# Altium project Francisco Gimenez.PrjPCB (part 1 of 3)
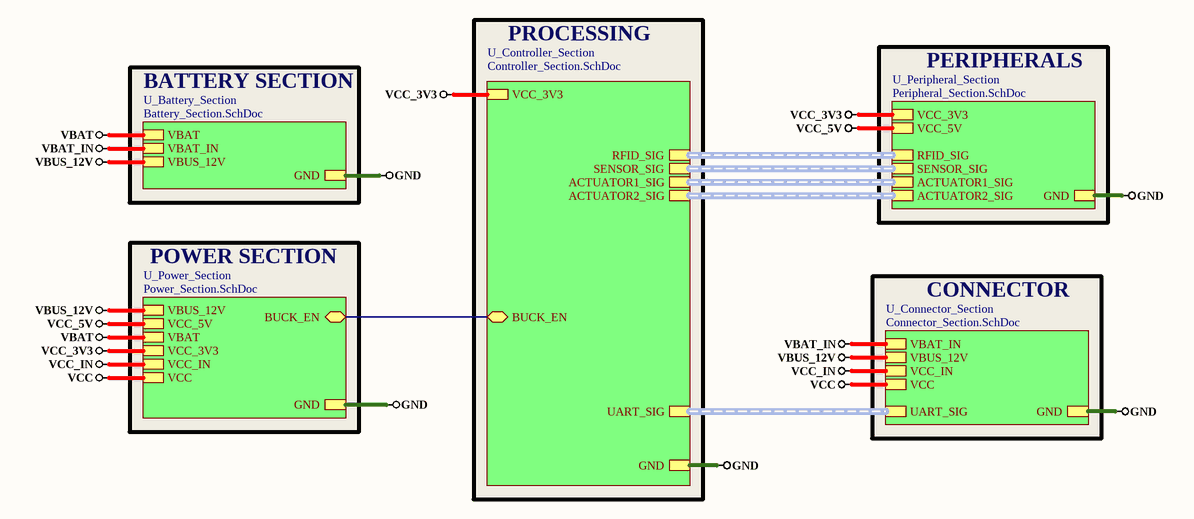
[diagram p0: Top_Sheet.SchDoc]
13 sheets, 112 parts. Net scope: hierarchical (ports join the sheet entries above them; power ports are global).
Board file: HCD_PCB.PcbDoc
Sheets:
  Top_Sheet.SchDoc
    U_Controller_Section = Controller_Section.SchDoc
    U_Connector_Section = Connector_Section.SchDoc
    U_Battery_Section = Battery_Section.SchDoc
      U_Battery_Management_Section = Battery_Management_Section.SchDoc
      U_LiFePo_Charging_Section = LiFePo_Charging_Section.SchDoc
    U_Peripheral_Section = Peripheral_Section.SchDoc
      U_Sensor_Section = Sensor_Section.SchDoc
      U_Actuator_Section = Actuator_Section.SchDoc
      U_Actuator_Section2 = Actuator_Section2.SchDoc
    U_Power_Section = Power_Section.SchDoc
      U_MCU_Power_Section = MCU_Power_Section.SchDoc
      U_Buck_Regulator_Section = Buck_Regulator_Section.SchDoc

## Sheet Top_Sheet.SchDoc
size A; DocumentNumber: 1; SheetNumber: 1; SheetTotal: 13

### Sub-sheets
U_Battery_Section = Battery_Section.SchDoc: VBAT, VBAT_IN, GND, VBUS_12V
U_Connector_Section = Connector_Section.SchDoc: GND, UART_SIG (harness UART_SIG), VBAT_IN, VBUS_12V, VCC_IN, VCC
U_Controller_Section = Controller_Section.SchDoc: ACTUATOR1_SIG (harness ACTUATOR1_SIG), ACTUATOR2_SIG (harness ACTUATOR2_SIG), GND, VCC_3V3, UART_SIG (harness UART_SIG), SENSOR_SIG (harness SENSOR_SIG), RFID_SIG (harness RFID_SIG), BUCK_EN (bidir)
U_Peripheral_Section = Peripheral_Section.SchDoc: GND, RFID_SIG (harness RFID_SIG), SENSOR_SIG (harness SENSOR_SIG), ACTUATOR2_SIG (harness ACTUATOR2_SIG), VCC_3V3, VCC_5V, ACTUATOR1_SIG (harness ACTUATOR1_SIG)
U_Power_Section = Power_Section.SchDoc: GND, VBUS_12V, VCC_5V, VBAT, VCC_3V3, VCC_IN, VCC, BUCK_EN (bidir)

### Nets
GND: sheet U_Controller_Section/GND, sheet U_Connector_Section/GND, sheet U_Battery_Section/GND, sheet U_Peripheral_Section/GND, sheet U_Power_Section/GND
VBAT: sheet U_Battery_Section/VBAT, sheet U_Power_Section/VBAT
VBAT_IN: sheet U_Connector_Section/VBAT_IN, sheet U_Battery_Section/VBAT_IN
VBUS_12V: sheet U_Connector_Section/VBUS_12V, sheet U_Battery_Section/VBUS_12V, sheet U_Power_Section/VBUS_12V
VCC: sheet U_Connector_Section/VCC, sheet U_Power_Section/VCC
VCC_3V3: sheet U_Controller_Section/VCC_3V3, sheet U_Peripheral_Section/VCC_3V3, sheet U_Power_Section/VCC_3V3
VCC_5V: sheet U_Peripheral_Section/VCC_5V, sheet U_Power_Section/VCC_5V
VCC_IN: sheet U_Connector_Section/VCC_IN, sheet U_Power_Section/VCC_IN
BUCK_EN: sheet U_Controller_Section/BUCK_EN, sheet U_Power_Section/BUCK_EN

### Buses and harness runs
harness sheet U_Connector_Section/UART_SIG = sheet U_Controller_Section/UART_SIG
harness sheet U_Controller_Section/ACTUATOR1_SIG = sheet U_Peripheral_Section/ACTUATOR1_SIG
harness sheet U_Controller_Section/ACTUATOR2_SIG = sheet U_Peripheral_Section/ACTUATOR2_SIG
harness sheet U_Controller_Section/RFID_SIG = sheet U_Peripheral_Section/RFID_SIG
harness sheet U_Controller_Section/SENSOR_SIG = sheet U_Peripheral_Section/SENSOR_SIG

### Notes on the sheet
- BATTERY SECTION
- PROCESSING
- PERIPHERALS
- POWER SECTION
- CONNECTOR

## Sheet Controller_Section.SchDoc
size A; DocumentNumber: 12; SheetNumber: 12; SheetTotal: 13
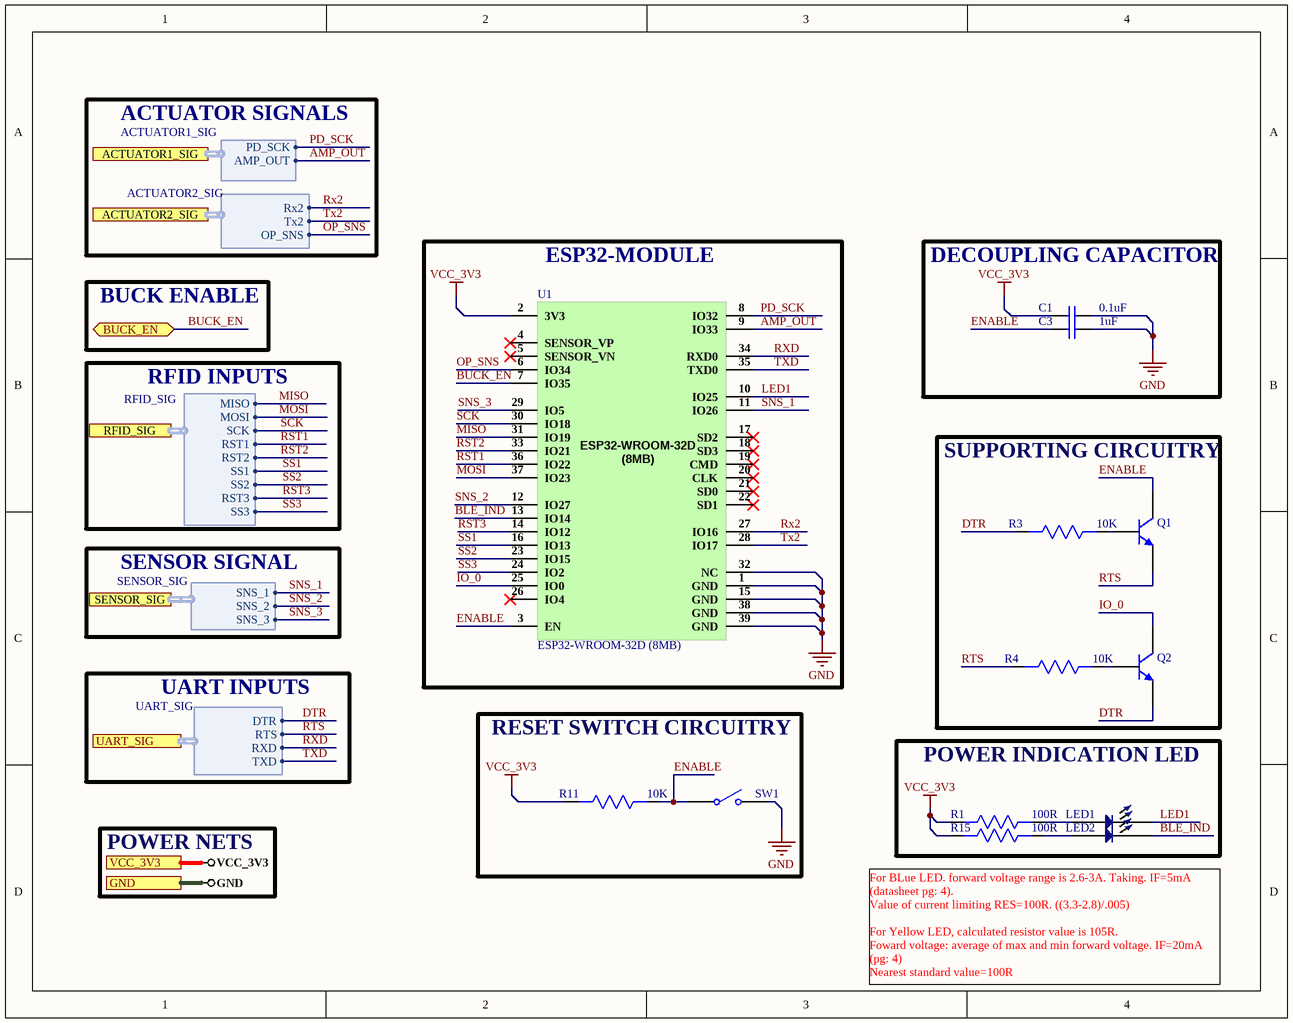
[diagram p1: Controller_Section.SchDoc]

### Parts
C1  0.1uF  [CAP-0603]
C3  1uF  [CAP-0603]
LED1  LTST-C170KSKT  [LTST-C170KSKT]  (value not drawn)
LED2  17-21/BHC-XL2M2TY/3T  [17-21/BHC-XL2M2TY/3T]  (value not drawn)
Q1  MMBT2222A-7-F  [sot-23]  (value not drawn)
Q2  MMBT2222A-7-F  [sot-23]  (value not drawn)
R1  100R  [RES-0603]
R3  10K  [RES-0603]
R4  10K  [RES-0603]
R11  10K  [RES-0603]
R15  100R  [RES-0603]
SW1  B3U-1000P  [B3U-1000P]  (value not drawn)
U1  ESP32-WROOM-32D (8MB)  [ESP32-WROOM-32D (8MB)]

### Blocks framed on the sheet
ESP32-MODULE: U1
DECOUPLING CAPACITOR: C1 C3
SUPPORTING CIRCUITRY: Q1 Q2 R3 R4
RESET SWITCH CIRCUITRY: R11 SW1
POWER INDICATION LED: LED1 LED2 R1 R15

### Ports
ACTUATOR1_SIG (harness ACTUATOR1_SIG), ACTUATOR2_SIG (harness ACTUATOR2_SIG), BUCK_EN (bidir), GND, RFID_SIG (harness RFID_SIG), SENSOR_SIG (harness SENSOR_SIG), UART_SIG (harness UART_SIG), VCC_3V3

### Harnesses
UART_SIG: RXD, TXD, DTR, RTS
SENSOR_SIG: SNS_1, SNS_2, SNS_3
ACTUATOR1_SIG: PD_SCK, AMP_OUT
ACTUATOR2_SIG: Rx2, Tx2, OP_SNS
RFID_SIG: MOSI, SCK, RST1, MISO, RST2, SS1, SS2, SS3, RST3

### Nets
GND: C1.2 C3.2 SW1.2 U1.1(GND) U1.15(GND) U1.32(NC) U1.38(GND) U1.39(GND) ; port GND
VCC_3V3: C1.1 R1.2 R11.2 R15.2 U1.2(3V3) ; port VCC_3V3
AMP_OUT: U1.9(IO33) ; port ACTUATOR1_SIG.AMP_OUT  [project net ACTUATOR1_SIG.AMP_OUT]
BLE_IND: LED2.2 U1.13(IO14)
BUCK_EN: U1.7(IO35) ; port BUCK_EN
DTR: Q2.2(E) R3.2 ; port UART_SIG.DTR
ENABLE: C3.1 Q1.3(C) R11.1 SW1.1 U1.3(EN)
IO_0: Q2.3(C) U1.25(IO0)
LED1: LED1.2 U1.10(IO25)
MISO: U1.31(IO19) ; port RFID_SIG.MISO
MOSI: U1.37(IO23) ; port RFID_SIG.MOSI
OP_SNS: U1.6(IO34) ; port ACTUATOR2_SIG.OP_SNS  [project net ACTUATOR2_SIG.OP_SNS]
PD_SCK: U1.8(IO32) ; port ACTUATOR1_SIG.PD_SCK  [project net ACTUATOR1_SIG.PD_SCK]
RST1: U1.36(IO22) ; port RFID_SIG.RST1  [project net RFID_SIG.RST1]
RST2: U1.33(IO21) ; port RFID_SIG.RST2  [project net RFID_SIG.RST2]
RTS: Q1.2(E) R4.2 ; port UART_SIG.RTS
Rx2: U1.27(IO16) ; port ACTUATOR2_SIG.Rx2  [project net ACTUATOR2_SIG.Rx2]
RXD: U1.34(RXD0) ; port UART_SIG.RXD
SCK: U1.30(IO18) ; port RFID_SIG.SCK  [project net RFID_SIG.SCK]
SNS_1: U1.11(IO26) ; port SENSOR_SIG.SNS_1  [project net SENSOR_SIG.SNS_1]
SNS_2: U1.12(IO27) ; port SENSOR_SIG.SNS_2  [project net SENSOR_SIG.SNS_2]
SNS_3: U1.29(IO5) ; port SENSOR_SIG.SNS_3  [project net SENSOR_SIG.SNS_3]
SS1: U1.16(IO13) ; port RFID_SIG.SS1  [project net RFID_SIG.SS1]
SS2: U1.23(IO15) ; port RFID_SIG.SS2  [project net RFID_SIG.SS2]
Tx2: U1.28(IO17) ; port ACTUATOR2_SIG.Tx2  [project net ACTUATOR2_SIG.Tx2]
TXD: U1.35(TXD0) ; port UART_SIG.TXD
NetLED1_1: LED1.1 R1.1
NetLED2_1: LED2.1 R15.1
NetQ1_1: Q1.1(B) R3.1
NetQ2_1: Q2.1(B) R4.1

Not connected (* = marked no-connect by the designer): U1 4(SENSOR_VP)* 5(SENSOR_VN)* 14(IO12) 17(SD2)* 18(SD3)* 19(CMD)* 20(CLK)* 21(SD0)* 22(SD1)* 24(IO2) 26(IO4)*

### Notes on the sheet
- ACTUATOR SIGNALS
- BUCK ENABLE
- RFID INPUTS
- SENSOR SIGNAL
- UART INPUTS
- POWER NETS
- For BLue LED. forward voltage range is 2.6-3A. Taking. IF=5mA (datasheet pg: 4).
  Value of current limiting RES=100R. ((3.3-2.8)/.005)
  For Yellow LED, calculated resistor value is 105R.
  Foward voltage: average of max and min forward voltage. IF=20mA (pg: 4)
  Nearest standard value=100R
- (in symbol ESP32-WROOM-32D (8MB)) ESP32-WROOM-32D (8MB) /

### Library data of the parts
C1 = CL10B104KB8NNNL: CAP CER 0.1UF 50V X7R 0603; Manufacturer: Samsung; Capacitance: 100nF; Tolerance: 10%; Supplier 1: Digi-Key; Manufacturer Part Number: CL10B104KB8NNNL; Stock 1: 3731229; Pricing 1: 1=0.1, 10=0.03, 50=0.0164, 100=0.0134, 500=0.00958, 1000=0.00753, 2500=0.00684, 5000=0.0063 (USD); Mount: Surface Mount; Case/Package: 0603; Min Operating Temperature: -55°C; Max Operating Temperature: 125°C; Dielectric: X7R; Packaging: Tape and Reel; Package Quantity: 15000; Voltage Rating: 50V; Voltage Rating (DC): 50V; Series: CL; Construction: Flat; Length: 1.6mm; Width: 0.031inch; Height: 0.8mm; Thickness: 0.035inch; Depth: 0.8mm; Radiation Hardening: No; RoHS Compliant: Yes; ComponentLink1URL: https://www.verical.com/server-webapp/html/getDatasheet?partID=357523&src-supplier=Verical; ComponentLink1Description: https://www.verical.com/server-webapp/html/getDatasheet?partID=357523&src-supplier=Verical; ComponentLink2URL: https://media.digikey.com/pdf/Data%20Sheets/Samsung%20PDFs/CL_Series_MLCC_ds.pdf?src-supplier=Digi-Key; ComponentLink2Description: https://media.digikey.com/pdf/Data%20Sheets/Samsung%20PDFs/CL_Series_MLCC_ds.pdf?src-supplier=Digi-Key; Supplier Part Number 1: 1276-CL10B104KB8NNNLCT-ND
C3 = CL10A105KA8NNNC: CAP CER 1UF 25V X5R 0603; Manufacturer: Sams; Tolerance: 10%; Supplier 1: Digi-Key; Manufacturer Part Number: CL10A105KA8NNNC; Stock 1: 2768758; Pricing 1: 1=0.1, 10=0.036, 50=0.0198, 100=0.0161, 500=0.01152, 1000=0.00904 (USD); Mount: Surface Mount; Case/Package: 0603; Min Operating Temperature: -55°C; Max Operating Temperature: 85°C; Capacitance: 1uF; Dielectric: X5R; Voltage Rating (DC): 25V; Voltage: 25V; Length: 1.6mm; Height: 0.8mm; Depth: 0.8mm; Lead Free: Lead Free; Supplier Part Number 1: 1276-1102-1-ND
LED1 = LTST-C170KSKT: Yellow 2 x 1.25 x 1.1 mm 130° Water Clear 112 mcd 1.8 V LED Surface Mount; Manufacturer: Vishay Lite-On; Lens Color: Colorless; Forward Voltage: 2.4V; Forward Current: 30mA; Luminous Intensity: 112mcd; Lens Style: Diffused,Colorless,Rectangular,Clear; Power Rating: 75mW; Dominant Wavelength: 587nm; Test Current: 20mA; Number of Elements: 1; Wavelength: 588nm; Reverse Voltage: 5V; Supplier 1: Digi-Key; Manufacturer Part Number: LTST-C170KSKT; RoHS: Yes; Category: LEDs; Stock 1: 4224; Pricing 1: 1=0.31000, 10=0.16900, 100=0.07860, 500=0.07260, 1000=0.05687 (USD); Mount: Surface Mount; Case/Package: 0805; Number of Pins: 2; Color: Yellow; Case Code (Metric): 2012; Case Code (Imperial): 0805; Min Operating Temperature: -55°C; Max Operating Temperature: 85°C; Packaging: Tape and Reel; Viewing Angle: 130°; Package Quantity: 1; Illumination Color: Yellow; Lens Transparency: Clear; Power Dissipation: 75mW; Number of LEDs: 1; Series: CHIPLED 0805; Length: 2mm; Width: 1.25mm; Height: 1.1mm; Depth: 1.25mm; Radiation Hardening: No; Lead Free: Lead Free; RoHS Compliant: Yes; ComponentLink1URL: https://datasheet.ciiva.com/11774/0900766b80dc027c-11774116.pdf?src-supplier=RSComponents; ComponentLink1Description: https://datasheet.ciiva.com/11774/0900766b80dc027c-11774116.pdf?src-supplier=RSComponents; ComponentLink2URL: https://datasheet.ciiva.com/12400/lite-on-ltst-c170kskt-187240-12400806.pdf?src-supplier=Mouser; ComponentLink2Description: https://datasheet.ciiva.com/12400/lite-on-ltst-c170kskt-187240-12400806.pdf?src-supplier=Mouser; ComponentLink3URL: https://datasheet.ciiva.com/16203/ltst-c170kskt-16203829.pdf?src-supplier=Future+Electronics; ComponentLink3Description: https://datasheet.ciiva.com/16203/ltst-c170kskt-16203829.pdf?src-supplier=Future+Electronics; ComponentLink4URL: https://datasheet.ciiva.com/15118/getdatasheetpartid-214541-15118098.pdf?src-supplier=Verical; ComponentLink4Description: https://datasheet.ciiva.com/15118/getdatasheetpartid-214541-15118098.pdf?src-supplier=Verical; ComponentLink5URL: https://datasheet.ciiva.com/2110/s-110-ltst-c170kskt-2110046.pdf?src-supplier=Digi-Key; ComponentLink5Description: https://datasheet.ciiva.com/2110/s-110-ltst-c170kskt-2110046.pdf?src-supplier=Digi-Key; ComponentLink6URL: https://datasheet.ciiva.com/2110/s-110-ltst-c170kskt-2110045.pdf?src-supplier=Digi-Key; ComponentLink6Description: https://datasheet.ciiva.com/2110/s-110-ltst-c170kskt-2110045.pdf?src-supplier=Digi-Key; ComponentLink7URL: https://datasheet.ciiva.com/2110/s-110-ltst-c170kskt-2110047.pdf?src-supplier=Digi-Key; ComponentLink7Description: https://datasheet.ciiva.com/2110/s-110-ltst-c170kskt-2110047.pdf?src-supplier=Digi-Key; Supplier Part Number 1: 160-1416-1-ND
LED2 = 17-21/BHC-XL2M2TY/3T: LED BLUE 0805 SMD; Manufacturer: Everlight Elec; Emitted Color: Blue; Package: 0805
Q1 Q2 = MMBT2222A-7-F: TRANS NPN 40V 0.6A SMD SOT23-3; Manufacturer: Diodes; Max Power Dissipation: 300mW; Collector Base Voltage (VCBO): 75V; Max Collector Current: 600mA; hFE Min: 100; Frequency: 300MHz; Number of Elements: 1; Emitter Base Voltage (VEBO): 6V; Collector Emitter Saturation Voltage: 1V; Power Dissipation: 350mW; Element Configuration: Single; Current: 1A; Supplier 1: Digi-Key; Manufacturer Part Number: MMBT2222A-7-F; Stock 1: 2471182; Pricing 1: 1=0.15, 10=0.134, 100=0.0729, 500=0.04486, 1000=0.03059 (USD); Mount: Surface Mount; Case/Package: SOT-23; Number of Pins: 3; Weight: 0.000282oz; Contact Plating: Matte,Tin; Min Operating Temperature: -55°C; Max Operating Temperature: 150°C; Packaging: Tape and Reel; Collector Emitter Voltage (VCEO): 40V; Polarity: NPN; Voltage Rating (DC): 40V; Package Quantity: 3000; Continuous Collector Current: 600mA; Collector Emitter Breakdown Voltage: 40V; Transition Frequency: 300MHz; Max Breakdown Voltage: 40V; Max Frequency: 300MHz; Termination: SMD/SMT; Gain Bandwidth Product: 300MHz; Current Rating: 600mA; Voltage: 40V; Length: 3.05mm; Height: 1mm; Width: 1.4mm; Radiation Hardening: No; Lead Free: Lead Free; REACH SVHC: No SVHC; ComponentLink1URL: http://www.diodes.com/datasheets/ds30041.pdf?src-supplier=Future+Electronics; ComponentLink1Description: http://www.diodes.com/datasheets/ds30041.pdf?src-supplier=Future+Electronics; ComponentLink2URL: http://www.diodes.com/datasheets/ds30041.pdf?src-supplier=Avnet; ComponentLink2Description: http://www.diodes.com/datasheets/ds30041.pdf?src-supplier=Avnet; ComponentLink3URL: https://www.verical.com/server-webapp/html/getDatasheet?partID=82692&src-supplier=Verical; ComponentLink3Description: https://www.verical.com/server-webapp/html/getDatasheet?partID=82692&src-supplier=Verical; ComponentLink4URL: https://www.diodes.com/assets/Datasheets/ds30041.pdf?src-supplier=Digi-Key; ComponentLink4Description: https://www.diodes.com/assets/Datasheets/ds30041.pdf?src-supplier=Digi-Key; ComponentLink5URL: http://www.diodes.com/datasheets/ds30041.pdf?src-supplier=Avnet+Europe; ComponentLink5Description: http://www.diodes.com/datasheets/ds30041.pdf?src-supplier=Avnet+Europe; ComponentLink6URL: http://www.diodes.com/datasheets/ds30041.pdf?src-supplier=Element14; ComponentLink6Description: http://www.diodes.com/datasheets/ds30041.pdf?src-supplier=Element14; Supplier Part Number 1: MMBT2222A-FDIDKR-ND
R1 R15 = RCA0603100RFKEAHP: RES SMD 100 OHM 1% 1/4W 0603; Manufacturer: Vishay Dale; Max Power Dissipation: 250mW; Temperature Coefficient: 100ppm/°C; Supplier 1: Digi-Key; Manufacturer Part Number: RCA0603100RFKEAHP; Stock 1: 0; Case/Package: 0603; Case Code (Imperial): 0603; Case Code (Metric): 1608; Min Operating Temperature: -55°C; Max Operating Temperature: 155°C; Resistor Type: Thick Film; Features: Automotive AEC-Q200,Anti-Sulfur; Packaging: Tape and Reel; Resistance: 100R; Tolerance: 1%; Number of Terminations: 2; RoHS Compliant: Yes; ComponentLink1URL: http://www.vishay.com/docs/20067/rcahp.pdf?src-supplier=Digi-Key; ComponentLink1Description: http://www.vishay.com/docs/20067/rcahp.pdf?src-supplier=Digi-Key; Supplier Part Number 1: 541-3244-2-ND
R3 R4 R11 = CRGH0603J10K: RES SMD 10K OHM 5% 1/5W 0603; Manufacturer: TE Connectivity Holsworthy; Resistance: 10kR; Temperature Coefficient: 100ppm/°C; Power Rating: 200mW; Voltage Rating: 50V; Number of Resistors: 1; ComponentLink1URL: http://www.farnell.com/datasheets/2167052.pdf?src-supplier=Element14; ComponentLink1Description: http://www.farnell.com/datasheets/2167052.pdf?src-supplier=Element14; ComponentLink2URL: https://www.rohm.com/datasheet/ESR01MZPF/esr-e?src-supplier=Digi-Key; ComponentLink2Description: https://www.rohm.com/datasheet/ESR01MZPF/esr-e?src-supplier=Digi-Key; Supplier 1: Digi-Key; Manufacturer Part Number: CRGH0603J10K; Stock 1: 85818; Pricing 1: 1=0.1, 10=0.049, 100=0.02, 1000=0.00899, 2500=0.0078 (USD); Mount: Surface Mount; Case/Package: 0603; Case Code (Imperial): 0603; Case Code (Metric): 1608; Min Operating Temperature: -55°C; Max Operating Temperature: 125°C; Tolerance: 5%; Packaging: Tape and Reel; Resistor Type: Thick Film,Power resistor; Number of Terminations: 2; Series: CRGH; Termination: Solder; Voltage Rating (DC): 50V; Resistance Tolerance: 5%; Technology: THICK FILM; Length: 1.6mm; Width: 0.8mm; Height: 0.45mm; Depth: 0.8mm; RoHS Compliant: Yes; REACH SVHC: No SVHC; ELV: Compliant; ComponentLink3URL: http://www.farnell.com/datasheets/2007183.pdf?src-supplier=Element14; ComponentLink3Description: http://www.farnell.com/datasheets/2007183.pdf?src-supplier=Element14; Supplier Part Number 1: A126394DKR-ND
SW1 = B3U-1000P: SWITCH TACTILE SPST-NO 0.05A 12V; Manufacturer: Omron; Mechanical Life: 200000Cycles; Operating Force: 1.5N; Throw Configuration: SPST; Current Rating: 50mA; Contact Resistance: 100mR; Illumination Type: Non-Illuminated,Illuminated; Switch Travel: 0.15mm; Switch Function: Off-Mom; Actuator Type: Standard; Actuator Length: 0.4mm; Ratings: Dust Proof,IP40; ComponentLink1URL: http://www.farnell.com/datasheets/60838.pdf?src-supplier=Farnell; ComponentLink1Description: http://www.farnell.com/datasheets/60838.pdf?src-supplier=Farnell; ComponentLink2URL: http://www.farnell.com/datasheets/60838.pdf?src-supplier=Element14; ComponentLink2Description: http://www.farnell.com/datasheets/60838.pdf?src-supplier=Element14; ComponentLink3URL: https://omronfs.omron.com/en_US/ecb/products/pdf/en-b3u.pdf?src-supplier=Digi-Key; ComponentLink3Description: https://omronfs.omron.com/en_US/ecb/products/pdf/en-b3u.pdf?src-supplier=Digi-Key; ComponentLink4URL: http://www.omron.com/ecb/products/pdf/en-b3u.pdf?src-supplier=Digi-Key; ComponentLink4Description: http://www.omron.com/ecb/products/pdf/en-b3u.pdf?src-supplier=Digi-Key; ComponentLink5URL: https://www.distrelec.biz/Web/Downloads/he/et/B3U_eng_datasheet.pdf?mime=application%2Fpdf&src-supplier=Distrelec; ComponentLink5Description: https://www.distrelec.biz/Web/Downloads/he/et/B3U_eng_datasheet.pdf?mime=application%2Fpdf&src-supplier=Distrelec; ComponentLink6URL: http://www.onlinecomponents.com/productFiles/mf-OM/en-b3u.pdf?src-supplier=Onlinecomponents.com; ComponentLink6Description: http://www.onlinecomponents.com/productFiles/mf-OM/en-b3u.pdf?src-supplier=Onlinecomponents.com; Supplier 1: Digi-Key; Manufacturer Part Number: B3U-1000P; Stock 1: 116454; Pricing 1: 1=1, 10=0.961, 25=0.9064, 50=0.7976, 100=0.7251, 250=0.68888, 500=0.67074, 1000=0.52571 (USD); Mount: Surface Mount; Weight: 0.000776oz; Contact Material: Silver; Min Operating Temperature: -25°C; Max Operating Temperature: 70°C; Packaging: Tape and Reel; Voltage Rating (DC): 12V; Package Quantity: 1; Max Current Rating: 50mA; Termination: SMD/SMT; Orientation: Straight; Max Voltage Rating (DC): 12V; Electrical Life: 200000Cycles; Insulation Resistance: 100MR; Contact Current Rating: 50mA; Length: 4mm; Height: 1.2mm; Depth: 2.5mm; Width: 3mm; REACH SVHC: Unknown; Lead Free: Lead Free; ComponentLink7URL: https://www.verical.com/server-webapp/html/getDatasheet?partID=552554&src-supplier=Verical; ComponentLink7Description: https://www.verical.com/server-webapp/html/getDatasheet?partID=552554&src-supplier=Verical; ComponentLink8URL: http://www.farnell.com/datasheets/1685550.pdf?src-supplier=Element14; ComponentLink8Description: http://www.farnell.com/datasheets/1685550.pdf?src-supplier=Element14; ComponentLink9URL: http://www.farnell.com/datasheets/2610940.pdf?src-supplier=Farnell; ComponentLink9Description: http://www.farnell.com/datasheets/2610940.pdf?src-supplier=Farnell; ComponentLink10URL: https://www.alliedelec.com/m/d/4c8a9ef82804fc3c241a13c1e298fd73.pdf?src-supplier=Allied+Electronics; ComponentLink10Description: https://www.alliedelec.com/m/d/4c8a9ef82804fc3c241a13c1e298fd73.pdf?src-supplier=Allied+Electronics; Supplier Part Number 1: SW1020DKR-ND
U1 = ESP32-WROOM-32D (8MB): RX TXRX MOD WIFI TRACE ANT SMD; Manufacturer: Espressif Systems; Interface: I2C,SPI,GPIO,PWM,SDIO,UART; Frequency: 2.5GHz; Data Rate: 150Mbps; Sensitivity: -98dBm; Memory Size: 536KB; Supplier 1: Digi-Key; Manufacturer Part Number: ESP32-WROOM-32D (8MB); RoHS: No; Stock 1: 2044; Pricing 1: 1=4.35000 (USD); Mount: Surface Mount; Case/Package: SMD/SMT; Min Operating Temperature: -40°C; Max Operating Temperature: 85°C; Packaging: Tape and Reel; ComponentLink1URL: https://www.espressif.com/sites/default/files/documentation/esp32-wroom-32d_esp32-wroom-32u_datasheet_en.pdf?src-supplier=Digi-Key; ComponentLink1Description: https://www.espressif.com/sites/default/files/documentation/esp32-wroom-32d_esp32-wroom-32u_datasheet_en.pdf?src-supplier=Digi-Key; Supplier Part Number 1: 1904-1024-1-ND

## Sheet Connector_Section.SchDoc
size A; DocumentNumber: 13; SheetNumber: 13; SheetTotal: 13
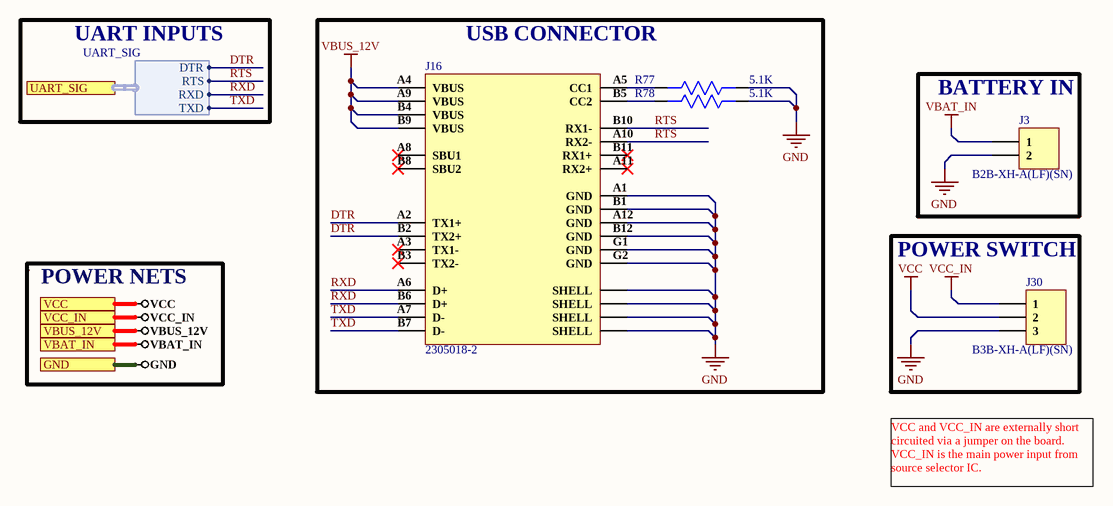
[diagram p2: Connector_Section.SchDoc]

### Parts
J3  B2B-XH-A(LF)(SN)  [B2B-XH-A(LF)(SN)]
J16  2305018-2  [2305018-2]
J30  B3B-XH-A(LF)(SN)  [B3B-XH-A(LF)(SN)]
R77  5.1K  [RES-0603]
R78  5.1K  [RES-0603]

### Blocks framed on the sheet
USB CONNECTOR: J16 R77 R78
BATTERY IN: J3
POWER SWITCH: J30

### Ports
GND, UART_SIG (harness UART_SIG), VBAT_IN, VBUS_12V, VCC, VCC_IN

### Harnesses
UART_SIG: RXD, TXD, DTR, RTS

### Nets
GND: J3.2 J16.A1(GND) J16.A12(GND) J16.B1(GND) J16.B12(GND) J16.G1(GND) J16.G2(GND) J16.S1(SHELL) J16.S2(SHELL) J16.S3(SHELL) J16.S4(SHELL) J30.3 R77.1 R78.1 ; port GND
VBAT_IN: J3.1 ; port VBAT_IN
VBUS_12V: J16.A4(VBUS) J16.A9(VBUS) J16.B4(VBUS) J16.B9(VBUS) ; port VBUS_12V
VCC: J30.2 ; port VCC
VCC_IN: J30.1 ; port VCC_IN
DTR: J16.A2(TX1+) J16.B2(TX2+) ; port UART_SIG.DTR
RTS: J16.A10(RX2-) J16.B10(RX1-) ; port UART_SIG.RTS
RXD: J16.A6(D+) J16.B6(D+) ; port UART_SIG.RXD
TXD: J16.A7(D-) J16.B7(D-) ; port UART_SIG.TXD
NetJ16_A5: J16.A5(CC1) R77.2
NetJ16_B5: J16.B5(CC2) R78.2

Not connected (* = marked no-connect by the designer): J16 A3(TX1-)* A8(SBU1)* A11(RX2+)* B3(TX2-)* B8(SBU2)* B11(RX1+)*

### Notes on the sheet
- UART INPUTS
- POWER NETS
- VCC and VCC_IN are externally short circuited via a jumper on the board. VCC_IN is the main power input from source selector IC.

### Library data of the parts
J3 = B2B-XH-A(LF)(SN): Conn Shrouded Header (4 Sides) HDR 2 POS 2.5mm Solder ST Thru-Hole Box; Manufacturer: JST; Number of Positions: 2; Connector Type: Male Pin; Current Rating: 3A; Contact Resistance: 20mR; Voltage Rating: 250V; Insulation Resistance: 1GR; Wire/Cable Gauge: 22AWG; Supplier 1: Farnell; Manufacturer Part Number: B2B-XH-A(LF)(SN); RoHS: Yes; Category: FFC / FPC; Stock 1: 219240; Pricing 1: 100=0.06860, 1000=0.04800, 2500=0.04520, 5000=0.04230, 10000=0.03950, 20000=0.03660 (GBP); Mount: Through Hole; Contact Plating: Tin,Copper,Lead; Color: Natural; Contact Material: Brass; Housing Color: White; Housing Material: Polyamide; Min Operating Temperature: -25°C; Max Operating Temperature: 85°C; Number of Rows: 1; Packaging: Bulk; Termination: Solder; Fastening Type: Detent; Max Current Rating: 3A; Voltage Rating (AC): 250V; Max Voltage Rating (AC): 250V; Number of Contacts: 2; Max Voltage Rating (DC): 250V; Orientation: Straight; Length: 7.4mm; Pitch: 2.5mm; Lead Pitch: 2.5mm; Depth: 5.75mm; REACH SVHC: No SVHC; Lead Free: Lead Free; ComponentLink1URL: https://datasheet.ciiva.com/26894/getdatasheetpartid-640357-26894434.pdf?src-supplier=Verical; ComponentLink1Description: https://datasheet.ciiva.com/26894/getdatasheetpartid-640357-26894434.pdf?src-supplier=Verical; ComponentLink2URL: https://datasheet.ciiva.com/11746/0900766b8082653e-11746979.pdf?src-supplier=RSComponents; ComponentLink2Description: https://datasheet.ciiva.com/11746/0900766b8082653e-11746979.pdf?src-supplier=RSComponents; ComponentLink3URL: https://datasheet.ciiva.com/26894/getdatasheetpartid-385291-26894760.pdf?src-supplier=Verical; ComponentLink3Description: https://datasheet.ciiva.com/26894/getdatasheetpartid-385291-26894760.pdf?src-supplier=Verical; ComponentLink4URL: https://datasheet.ciiva.com/8052/5448-8052024.pdf?src-supplier=Element14; ComponentLink4Description: https://datasheet.ciiva.com/8052/5448-8052024.pdf?src-supplier=Element14; ComponentLink5URL: https://datasheet.ciiva.com/20207/523653-20207167.pdf?src-supplier=Rapid+Electronics; ComponentLink5Description: https://datasheet.ciiva.com/20207/523653-20207167.pdf?src-supplier=Rapid+Electronics; Supplier Part Number 1: 1516276
J16 = 2305018-2: CONN RCP USB3.1 TYPEC 24P SMD RA
J30 = B3B-XH-A(LF)(SN): CONN HEADER VERT 3POS 2.5MM; Manufacturer: JST; Current Rating: 3A; Number of Positions: 3; Voltage Rating (AC): 250V; Contact Resistance: 20mR; Insulation Resistance: 1GR; Gender: Male; Wire/Cable Gauge: 22AWG; Supplier 1: Digi-Key; Manufacturer Part Number: B3B-XH-A(LF)(SN); Stock 1: 3453; Pricing 1: 1=0.19, 10=0.181, 25=0.1344, 50=0.1154, 250=0.09612, 750=0.08652, 1000=0.08075, 12000=0.06152, 24000=0.05575 (USD); Mount: Through Hole; Contact Plating: Tin,Lead,Copper; Contact Material: Brass; Color: Natural; Housing Color: White; Housing Material: Polyamide; Contact Shape: Square; Contact Finish - Mating: TIN; Insulation Material: Nylon; Insulation Color: Natural; Min Operating Temperature: -25°C; Max Operating Temperature: 85°C; Number of Rows: 1; Packaging: Bulk; Termination: Solder; Connector Type: Header; Series: XH; Contact Type: Male Pin; Max Current Rating: 3A; Voltage Rating: 250V; Fastening Type: Detent; Number of Contacts: 3; Max Voltage Rating (AC): 250V; Max Voltage Rating (DC): 250V; Orientation: Straight; Length: 9.9mm; Pitch: 2.5mm; Lead Pitch: 2.5mm; Depth: 5.75mm; Lead Free: Lead Free; REACH SVHC: No SVHC; Flammability Rating: UL94 V-0; ComponentLink1URL: https://www.verical.com/server-webapp/html/getDatasheet?partID=640434&src-supplier=Verical; ComponentLink1Description: https://www.verical.com/server-webapp/html/getDatasheet?partID=640434&src-supplier=Verical; ComponentLink2URL: https://www.verical.com/server-webapp/html/getDatasheet?partID=440399&src-supplier=Verical; ComponentLink2Description: https://www.verical.com/server-webapp/html/getDatasheet?partID=440399&src-supplier=Verical; Supplier Part Number 1: 455-2248-ND
R77 R78 = RMCF0603FT5K10: RES 5.1K OHM 1% 1/10W 0603; Manufacturer: Stackpole Electronics; Resistance: 5.1kR; Max Power Dissipation: 100mW; Temperature Coefficient: 100ppm/°C; Supplier 1: Digi-Key; Manufacturer Part Number: RMCF0603FT5K10; Stock 1: 58341; Pricing 1: 1=0.1, 10=0.017, 100=0.0068, 1000=0.00305, 2500=0.00264 (USD); Mount: Surface Mount; Case/Package: 0603; Case Code (Metric): 1608; Case Code (Imperial): 0603; Contact Plating: Tin,Matte; Min Operating Temperature: -55°C; Max Operating Temperature: 155°C; Tolerance: 1%; Packaging: Tape and Reel; Resistor Type: Thick Film; Number of Terminations: 2; Features: Automotive AEC-Q200; Series: RMCF; Length: 0.061inch; Width: 0.031inch; Height: 0.022inch; Radiation Hardening: No; RoHS Compliant: Yes; ComponentLink1URL: https://www.seielect.com/catalog/SEI-RMCF_RMCP.pdf?src-supplier=Avnet; ComponentLink1Description: https://www.seielect.com/catalog/SEI-RMCF_RMCP.pdf?src-supplier=Avnet; ComponentLink2URL: http://components.arrow.com/part/dataview/50863347S9465827N1174?src-supplier=Arrow+Electronics; ComponentLink2Description: http://components.arrow.com/part/dataview/50863347S9465827N1174?src-supplier=Arrow+Electronics; ComponentLink3URL: https://www.seielect.com/catalog/SEI-Packaging.pdf?src-supplier=Digi-Key; ComponentLink3Description: https://www.seielect.com/catalog/SEI-Packaging.pdf?src-supplier=Digi-Key; Supplier Part Number 1: RMCF0603FT5K10DKR-ND

## Sheet Battery_Section.SchDoc
size A4; DocumentNumber: 2; SheetNumber: 2; SheetTotal: 13
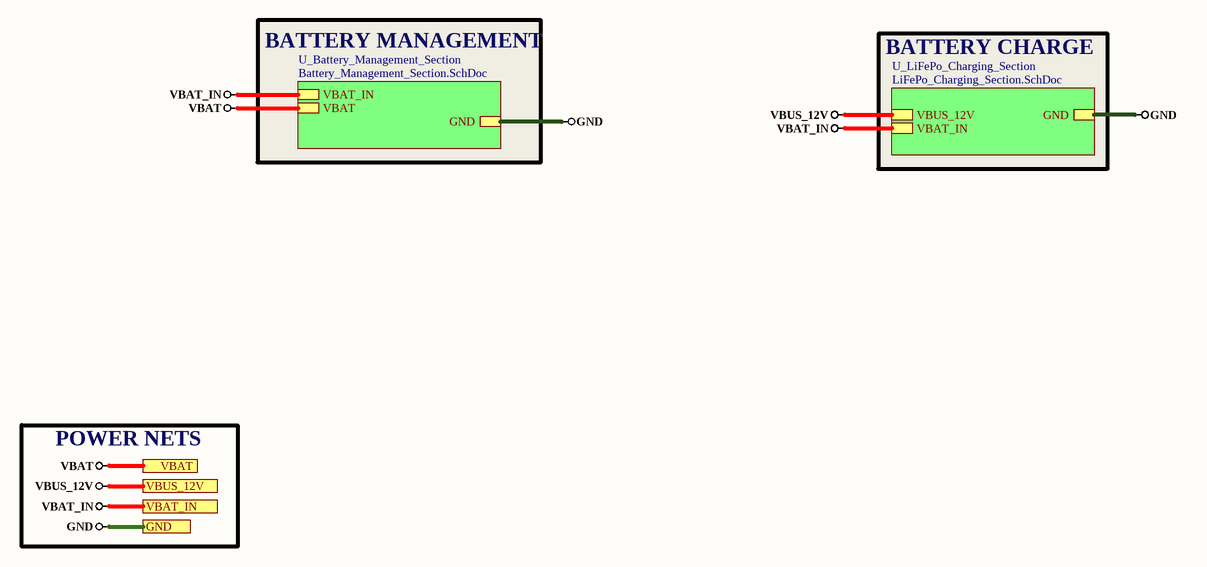
[diagram p3: Battery_Section.SchDoc]

### Sub-sheets
U_Battery_Management_Section = Battery_Management_Section.SchDoc: GND, VBAT, VBAT_IN
U_LiFePo_Charging_Section = LiFePo_Charging_Section.SchDoc: GND, VBUS_12V, VBAT_IN

### Ports
GND, VBAT, VBAT_IN, VBUS_12V

### Nets
GND: port GND, sheet U_Battery_Management_Section/GND, sheet U_LiFePo_Charging_Section/GND
VBAT: port VBAT, sheet U_Battery_Management_Section/VBAT
VBAT_IN: port VBAT_IN, sheet U_Battery_Management_Section/VBAT_IN, sheet U_LiFePo_Charging_Section/VBAT_IN
VBUS_12V: port VBUS_12V, sheet U_LiFePo_Charging_Section/VBUS_12V

### Notes on the sheet
- BATTERY MANAGEMENT
- BATTERY CHARGE
- POWER NETS

## Sheet Battery_Management_Section.SchDoc
size A; DocumentNumber: 3; SheetNumber: 3; SheetTotal: 13
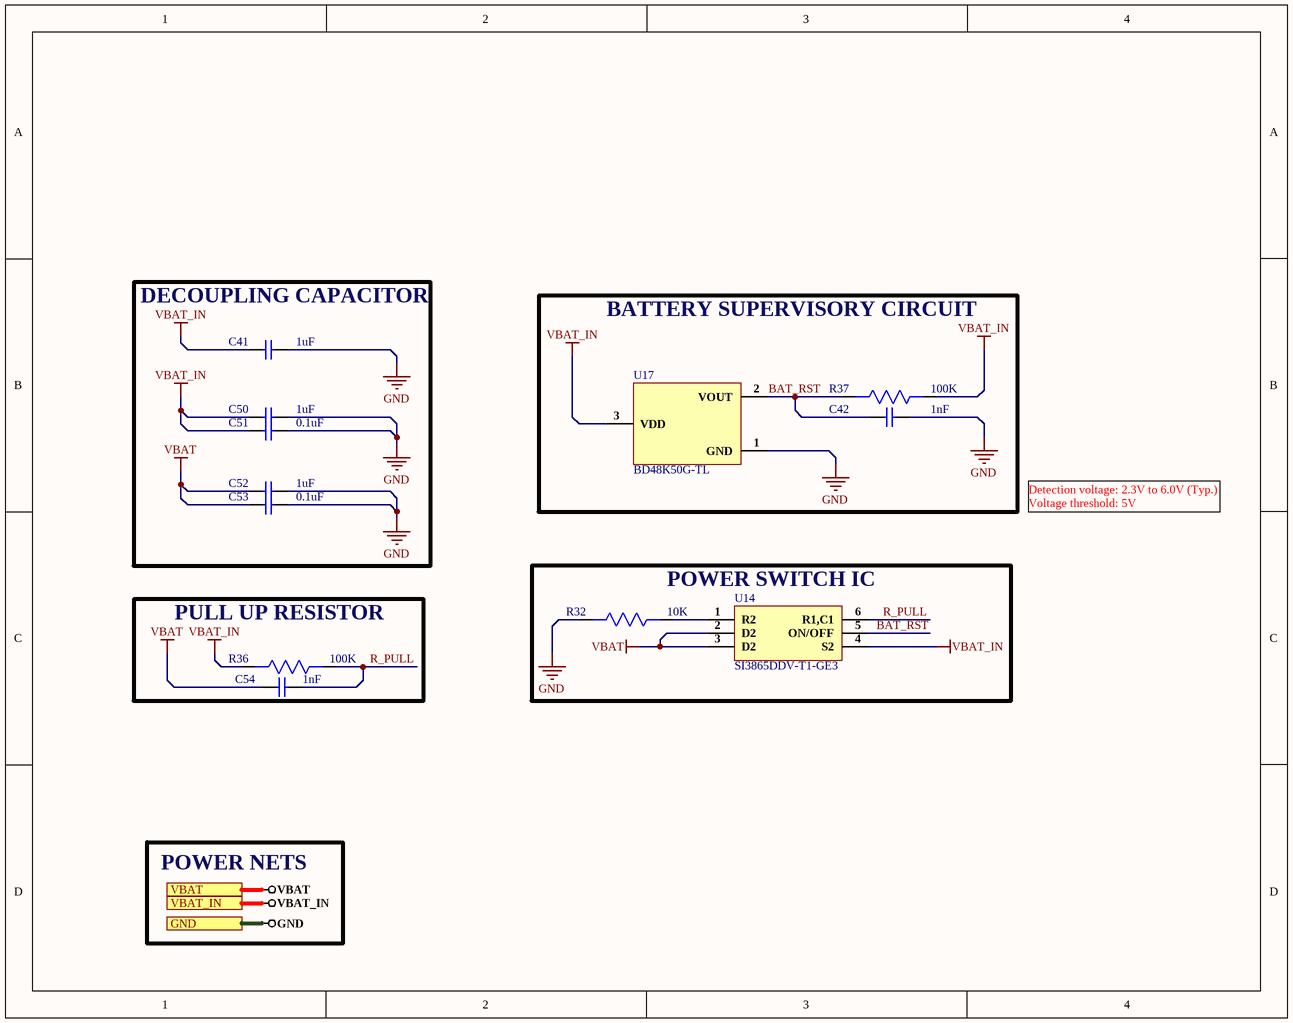
[diagram p4: Battery_Management_Section.SchDoc]

### Parts
C41  1uF  [CAP-0603]
C42  1nF  [CAP-0603]
C50  1uF  [CAP-0603]
C51  0.1uF  [CAP-0603]
C52  1uF  [CAP-0603]
C53  0.1uF  [CAP-0603]
C54  1nF  [CAP-0603]
R32  10K  [RES-0603]
R36  100K  [RES-0603]
R37  100K  [RES-0603]
U14  SI3865DDV-T1-GE3  [6-TSOP]
U17  BD48K50G-TL  [SSOP-3]

### Blocks framed on the sheet
DECOUPLING CAPACITOR: C41 C50-C53
BATTERY SUPERVISORY CIRCUIT: C42 R37 U17
PULL UP RESISTOR: C54 R36
POWER SWITCH IC: R32 U14

### Ports
GND, VBAT, VBAT_IN

### Nets
GND: C41.2 C42.2 C50.2 C51.2 C52.2 C53.2 R32.2 U17.1(GND) ; port GND
VBAT: C52.1 C53.1 C54.1 U14.2(D2) U14.3(D2) ; port VBAT
VBAT_IN: C41.1 C50.1 C51.1 R36.2 R37.1 U14.4(S2) U17.3(VDD) ; port VBAT_IN
BAT_RST: C42.1 R37.2 U14.5(ON/OFF) U17.2(VOUT)
R_PULL: C54.2 R36.1 U14.6(R1,C1)
NetR32_1: R32.1 U14.1(R2)

### Notes on the sheet
- Detection voltage: 2.3V to 6.0V (Typ.)
  Voltage threshold: 5V
- POWER NETS

### Library data of the parts
C41 C50 C52 = CL10A105KA8NNNC: as C3 on sheet Controller_Section; Supplier 1: Digi-Key; Manufacturer Part Number: CL10A105KA8NNNC; Stock 1: 2768758; Pricing 1: 1=0.1, 10=0.036, 50=0.0198, 100=0.0161, 500=0.01152, 1000=0.00904 (USD); Mount: Surface Mount; Case/Package: 0603; Min Operating Temperature: -55°C; Max Operating Temperature: 85°C; Capacitance: 1uF; Dielectric: X5R; Voltage Rating (DC): 25V; Voltage: 25V; Length: 1.6mm; Height: 0.8mm; Depth: 0.8mm; Lead Free: Lead Free; Supplier Part Number 1: 1276-1102-1-ND
C42 C54 = CC0603JRNPO8BN102: CAP CER 1000PF 25V C0G/NPO 0603; Manufacturer: Yageo; Tolerance: 5%; Dielectric: C0G; Supplier 1: Digi-Key; Manufacturer Part Number: CC0603JRNPO8BN102; Stock 1: 290818; Pricing 1: 1=0.1, 10=0.072, 50=0.0394, 100=0.0322, 500=0.02298, 1000=0.01806 (USD); Mount: Surface Mount; Case/Package: 0603; Case Code (Metric): 1608; Case Code (Imperial): 0603; Min Operating Temperature: -55°C; Max Operating Temperature: 125°C; Capacitance: 1nF; Voltage Rating: 25V; Packaging: Tape and Reel; Package Quantity: 1; Termination: SMD/SMT; Voltage Rating (DC): 25V; Series: CC; Construction: Flat; Length: 1.6mm; Width: 0.031inch; Height: 0.8mm; Thickness: 0.035inch; Depth: 0.8mm; Radiation Hardening: No; REACH SVHC: Unknown; Lead Free: Lead Free; RoHS Compliant: Yes; ComponentLink1URL: http://www.farnell.com/datasheets/1132289.pdf?src-supplier=Element14; ComponentLink1Description: http://www.farnell.com/datasheets/1132289.pdf?src-supplier=Element14; ComponentLink2URL: http://www.farnell.com/datasheets/2213336.pdf?src-supplier=Element14; ComponentLink2Description: http://www.farnell.com/datasheets/2213336.pdf?src-supplier=Element14; ComponentLink3URL: http://www.yageo.com/documents/recent/UPY-GP_NP0_16V-to-50V_16.pdf?src-supplier=Digi-Key; ComponentLink3Description: http://www.yageo.com/documents/recent/UPY-GP_NP0_16V-to-50V_16.pdf?src-supplier=Digi-Key; ComponentLink4URL: http://www.yageo.com/exep/pages/download/literatures/ProductSelectionGuide%202014_Final_2.pdf?src-supplier=Digi-Key; ComponentLink4Description: http://www.yageo.com/exep/pages/download/literatures/ProductSelectionGuide%202014_Final_2.pdf?src-supplier=Digi-Key; ComponentLink5URL: http://www.yageo.com/documents/recent/UPY-GP_NP0_16V-to-50V_8.pdf?src-supplier=Avnet; ComponentLink5Description: http://www.yageo.com/documents/recent/UPY-GP_NP0_16V-to-50V_8.pdf?src-supplier=Avnet; ComponentLink6URL: https://www.verical.com/server-webapp/html/getDatasheet?partID=403523&src-supplier=Verical; ComponentLink6Description: https://www.verical.com/server-webapp/html/getDatasheet?partID=403523&src-supplier=Verical; ComponentLink7URL: http://www.yageo.com/documents/recent/UPY-GP_NP0_16V-to-50V_8.pdf?src-supplier=Avnet+Europe; ComponentLink7Description: http://www.yageo.com/documents/recent/UPY-GP_NP0_16V-to-50V_8.pdf?src-supplier=Avnet+Europe; Supplier Part Number 1: 311-1342-1-ND
C51 C53 = CL10B104KB8NNNL: as C1 on sheet Controller_Section; Supplier 1: Digi-Key; Manufacturer Part Number: CL10B104KB8NNNL; Stock 1: 3731229; Pricing 1: 1=0.1, 10=0.03, 50=0.0164, 100=0.0134, 500=0.00958, 1000=0.00753, 2500=0.00684, 5000=0.0063 (USD); Mount: Surface Mount; Case/Package: 0603; Min Operating Temperature: -55°C; Max Operating Temperature: 125°C; Dielectric: X7R; Packaging: Tape and Reel; Package Quantity: 15000; Voltage Rating: 50V; Voltage Rating (DC): 50V; Series: CL; Construction: Flat; Length: 1.6mm; Width: 0.031inch; Height: 0.8mm; Thickness: 0.035inch; Depth: 0.8mm; Radiation Hardening: No; RoHS Compliant: Yes; ComponentLink1URL: https://www.verical.com/server-webapp/html/getDatasheet?partID=357523&src-supplier=Verical; ComponentLink1Description: https://www.verical.com/server-webapp/html/getDatasheet?partID=357523&src-supplier=Verical; ComponentLink2URL: https://media.digikey.com/pdf/Data%20Sheets/Samsung%20PDFs/CL_Series_MLCC_ds.pdf?src-supplier=Digi-Key; ComponentLink2Description: https://media.digikey.com/pdf/Data%20Sheets/Samsung%20PDFs/CL_Series_MLCC_ds.pdf?src-supplier=Digi-Key; Supplier Part Number 1: 1276-CL10B104KB8NNNLCT-ND
R32 = CRGH0603J10K: as R3 on sheet Controller_Section; ComponentLink1URL: http://www.farnell.com/datasheets/2167052.pdf?src-supplier=Element14; ComponentLink1Description: http://www.farnell.com/datasheets/2167052.pdf?src-supplier=Element14; ComponentLink2URL: https://www.rohm.com/datasheet/ESR01MZPF/esr-e?src-supplier=Digi-Key; ComponentLink2Description: https://www.rohm.com/datasheet/ESR01MZPF/esr-e?src-supplier=Digi-Key; Supplier 1: Digi-Key; Manufacturer Part Number: CRGH0603J10K; Stock 1: 85818; Pricing 1: 1=0.1, 10=0.049, 100=0.02, 1000=0.00899, 2500=0.0078 (USD); Mount: Surface Mount; Case/Package: 0603; Case Code (Imperial): 0603; Case Code (Metric): 1608; Min Operating Temperature: -55°C; Max Operating Temperature: 125°C; Tolerance: 5%; Packaging: Tape and Reel; Resistor Type: Thick Film,Power resistor; Number of Terminations: 2; Series: CRGH; Termination: Solder; Voltage Rating (DC): 50V; Resistance Tolerance: 5%; Technology: THICK FILM; Length: 1.6mm; Width: 0.8mm; Height: 0.45mm; Depth: 0.8mm; RoHS Compliant: Yes; REACH SVHC: No SVHC; ELV: Compliant; ComponentLink3URL: http://www.farnell.com/datasheets/2007183.pdf?src-supplier=Element14; ComponentLink3Description: http://www.farnell.com/datasheets/2007183.pdf?src-supplier=Element14; Supplier Part Number 1: A126394DKR-ND
R36 R37 = CRGH0603J100K: RES SMD 100K OHM 5% 1/5W 0603; Manufacturer: TE Connectivity; Resistance: 100kR; Temperature Coefficient: 100ppm/°C; Power Rating: 200mW; Voltage Rating: 50V; Number of Resistors: 1; Supplier 1: Digi-Key; Manufacturer Part Number: CRGH0603J100K; Stock 1: 23277; Pricing 1: 1=0.1, 10=0.049, 100=0.02, 1000=0.00899, 2500=0.0078 (USD); Mount: Surface Mount; Case/Package: 0603; Case Code (Imperial): 0603; Case Code (Metric): 1608; Min Operating Temperature: -55°C; Max Operating Temperature: 125°C; Tolerance: 5%; Packaging: Tape and Reel; Resistor Type: Thick Film,Power resistor; Number of Terminations: 2; Series: CRGH; Termination: Solder; Voltage Rating (DC): 50V; Resistance Tolerance: 5%; Technology: THICK FILM; Length: 1.6mm; Width: 0.8mm; Height: 0.45mm; Depth: 0.8mm; RoHS Compliant: Yes; REACH SVHC: No SVHC; ELV: Compliant; ComponentLink1URL: http://www.farnell.com/datasheets/2007183.pdf?src-supplier=Element14; ComponentLink1Description: http://www.farnell.com/datasheets/2007183.pdf?src-supplier=Element14; Supplier Part Number 1: A126393DKR-ND
U14 = SI3865DDV-T1-GE3: IC PWR SWITCH P-CHAN 1:1 6TSOP; Manufacturer: Vishay; Output Current: 1A; Number of Outputs: 1; Max Power Dissipation: 830mW; Max Supply Voltage: 12V; Min Supply Voltage: 1.5V; Interface: On/Off; Max Output Current: 2.8A; On-State Resistance: 165mR; Output Configuration: High Side; On-state Resistance-Max: 54mR; Supplier 1: Digi-Key; Manufacturer Part Number: SI3865DDV-T1-GE3; Stock 1: 54870; Pricing 1: 1=0.58, 10=0.494, 25=0.462, 100=0.3432, 500=0.26796, 1000=0.2178 (USD); Mount: Surface Mount; Case/Package: TSOP; Number of Pins: 6; Weight: 0.000705oz; Min Operating Temperature: -55°C; Max Operating Temperature: 150°C; Packaging: Tape and Reel; Package Quantity: 3000; Power Dissipation: 830mW; Current Rating: 2.8A; Series: TrenchFET®; Rated Current-Max: 2.8A; Length: 3.1mm; Width: 1.7mm; Height: 1mm; Radiation Hardening: No; REACH SVHC: No SVHC; Lead Free: Lead Free; RoHS Compliant: Yes; ComponentLink1URL: http://www.mouser.com/ds/2/427/si3865ddv-256526.pdf?src-supplier=Mouser; ComponentLink1Description: http://www.mouser.com/ds/2/427/si3865ddv-256526.pdf?src-supplier=Mouser; ComponentLink2URL: http://www.vishay.com/docs/67998/si3865ddv.pdf?src-supplier=Avnet; ComponentLink2Description: http://www.vishay.com/docs/67998/si3865ddv.pdf?src-supplier=Avnet; ComponentLink3URL: https://www.verical.com/server-webapp/html/getDatasheet?partID=710254&src-supplier=Verical; ComponentLink3Description: https://www.verical.com/server-webapp/html/getDatasheet?partID=710254&src-supplier=Verical; ComponentLink4URL: https://media.digikey.com/pdf/Data%20Sheets/Vishay%20Siliconix%20PDFs/Si3865DDV.pdf?src-supplier=Digi-Key; ComponentLink4Description: https://media.digikey.com/pdf/Data%20Sheets/Vishay%20Siliconix%20PDFs/Si3865DDV.pdf?src-supplier=Digi-Key; Supplier Part Number 1: SI3865DDV-T1-GE3CT-ND
U17 = BD48K50G-TL: IC SUPERVISOR 1 CHANNEL 3SSOP; Manufacturer: Rohm; Max Supply Voltage: 6V; Min Supply Voltage: 2.3V; Number of Voltages Monitored: 1; Reset: Active Low; Threshold Voltage: 5V; Accuracy: 1%; Operating Supply Current: 900nA; Supplier 1: Digi-Key; Manufacturer Part Number: BD48K50G-TL; RoHS: Yes; Category: Voltage Supervisors; Stock 1: 3673; Pricing 1: 1=0.48000, 10=0.39000, 25=0.35680, 100=0.26560, 250=0.24068, 500=0.19920, 1000=0.14940 (USD); Mount: Surface Mount; Case/Package: TO-236-3; Number of Pins: 3; Min Operating Temperature: -40°C; Max Operating Temperature: 105°C; Package Quantity: 3000; Packaging: Tape and Reel; Number of Monitored Inputs: 1; Type: Simple Reset/Power-On Reset; Series: BD48xxx; Lead Free: Lead Free; RoHS Compliant: Yes; ComponentLink1URL: https://datasheet.ciiva.com/15105/getdatasheetpartid-705737-15105785.pdf?src-supplier=Verical; ComponentLink1Description: https://datasheet.ciiva.com/15105/getdatasheetpartid-705737-15105785.pdf?src-supplier=Verical; ComponentLink2URL: https://datasheet.ciiva.com/6602/bd48xxg-e-6602101.pdf?src-supplier=Digi-Key; ComponentLink2Description: https://datasheet.ciiva.com/6602/bd48xxg-e-6602101.pdf?src-supplier=Digi-Key; Supplier Part Number 1: BD48K50G-TLCT-ND